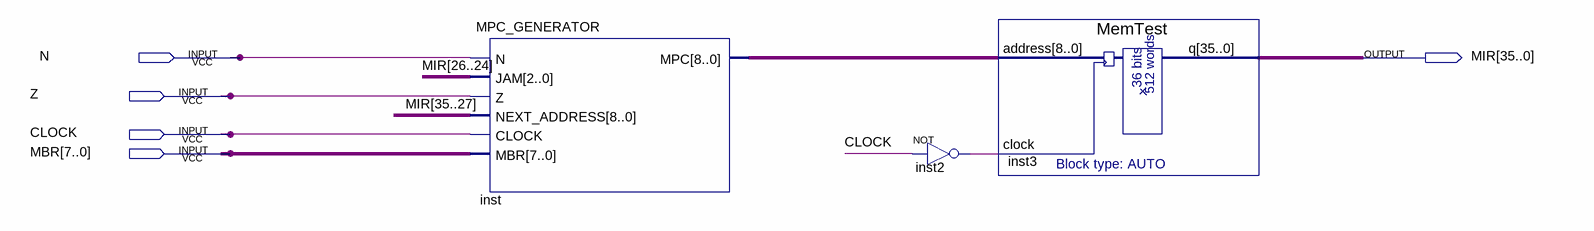
[diagram p0: schematic sheet]
// Quartus schematic microprogram.bdf as structural Verilog: 3 symbols, 5 pins
module microprogram (
  input  N,
  input  Z,
  input  CLOCK,
  input  [7:0] MBR,
  output [35:0] MIR
);

  wire inst2_out;
  wire [8:0] inst_mpc;

  MPC_GENERATOR inst (
    .N(N), .JAM(MIR[26:24]), .Z(Z), .NEXT_ADDRESS(MIR[35:27]), .CLOCK(CLOCK), .MBR(MBR), .MPC(inst_mpc));
  not inst2 (inst2_out, CLOCK);
  MemTest inst3 (.address(inst_mpc), .clock(inst2_out), .q(MIR));
endmodule
